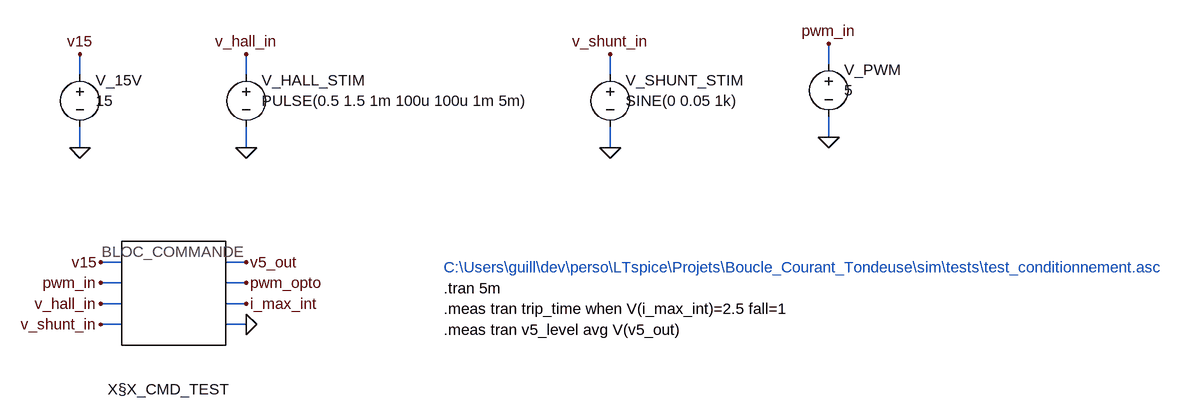
[diagram p0: schematic test_conditionnement.asc]
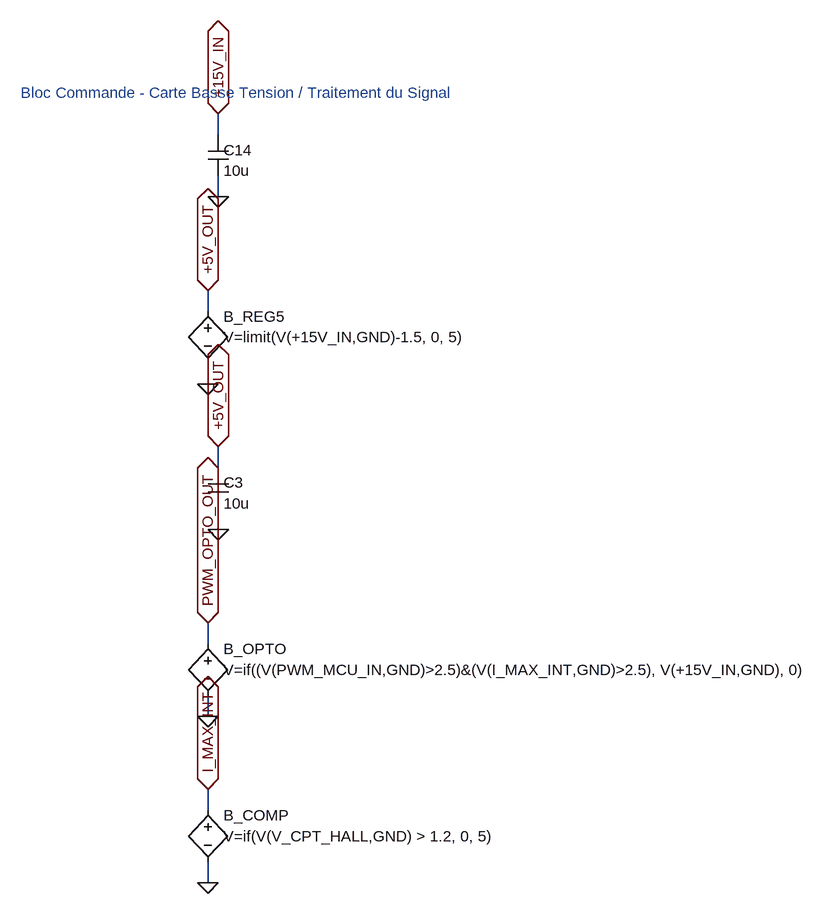
[diagram p1: sub-circuit bloc_commande.asc]
test_conditionnement.asc, the LTspice schematic file:
Version 4.1
SHEET 1 3200 2400
WIRE 944 144 944 112
WIRE -208 160 -208 128
WIRE 48 160 48 128
WIRE 608 160 608 128
WIRE 944 256 944 224
WIRE -208 272 -208 240
WIRE 48 272 48 240
WIRE 608 272 608 240
WIRE -144 448 -176 448
WIRE 48 448 16 448
WIRE -144 480 -176 480
WIRE 48 480 16 480
WIRE -144 512 -176 512
WIRE 48 512 16 512
WIRE -144 544 -176 544
WIRE 48 544 16 544
FLAG -208 128 v15
FLAG -208 272 0
FLAG 48 128 v_hall_in
FLAG 48 272 0
FLAG 608 128 v_shunt_in
FLAG 608 272 0
FLAG 944 112 pwm_in
FLAG 944 256 0
FLAG -176 448 v15
FLAG -176 480 pwm_in
FLAG -176 512 v_hall_in
FLAG -176 544 v_shunt_in
FLAG 48 448 v5_out
FLAG 48 480 pwm_opto
FLAG 48 512 i_max_int
FLAG 48 544 0
SYMBOL voltage -208 144 R0
WINDOW 0 24 24 Left 2
WINDOW 3 24 56 Left 2
SYMATTR InstName V_15V
SYMATTR Value 15
SYMBOL voltage 48 144 R0
WINDOW 0 24 24 Left 2
WINDOW 3 24 56 Left 2
SYMATTR InstName V_HALL_STIM
SYMATTR Value PULSE(0.5 1.5 1m 100u 100u 1m 5m)
SYMBOL voltage 608 144 R0
WINDOW 0 24 24 Left 2
WINDOW 3 24 56 Left 2
SYMATTR InstName V_SHUNT_STIM
SYMATTR Value SINE(0 0.05 1k)
SYMBOL voltage 944 128 R0
WINDOW 0 24 24 Left 2
WINDOW 3 24 56 Left 2
SYMATTR InstName V_PWM
SYMATTR Value 5
SYMBOL ..\\blocks\\bloc_commande -64 496 R0
WINDOW 0 -101 148 Left 2
WINDOW 3 24 56 Left 2
SYMATTR InstName X§X_CMD_TEST
TEXT 352 456 Left 2 ;C:\\Users\\guill\\dev\\perso\\LTspice\\Projets\\Boucle_Courant_Tondeuse\\sim\\tests\\test_conditionnement.asc
TEXT 352 488 Left 2 !.tran 5m
TEXT 352 520 Left 2 !.meas tran trip_time when V(i_max_int)=2.5 fall=1
TEXT 352 552 Left 2 !.meas tran v5_level avg V(v5_out)

bloc_commande.asc, the sub-circuit schematic file:
Version 4
SHEET 1 3200 2400
TEXT 32 32 Left 2 ;Bloc Commande - Carte Basse Tension / Traitement du Signal
SYMBOL cap 320 96 R0
WINDOW 0 24 24 Left 2
WINDOW 3 24 56 Left 2
SYMATTR InstName C14
SYMATTR Value 10u
WIRE 336 96 336 64
FLAG 336 64 +15V_IN
IOPIN 336 64 BiDir
WIRE 336 160 336 192
FLAG 336 192 0
IOPIN 336 192 BiDir
SYMBOL bv 320 352 R0
WINDOW 0 24 24 Left 2
WINDOW 3 24 56 Left 2
SYMATTR InstName B_REG5
SYMATTR Value V=limit(V(+15V_IN,GND)-1.5, 0, 5)
WIRE 320 368 320 336
FLAG 320 336 +5V_OUT
IOPIN 320 336 BiDir
WIRE 320 448 320 480
FLAG 320 480 0
IOPIN 320 480 BiDir
SYMBOL cap 320 608 R0
WINDOW 0 24 24 Left 2
WINDOW 3 24 56 Left 2
SYMATTR InstName C3
SYMATTR Value 10u
WIRE 336 608 336 576
FLAG 336 576 +5V_OUT
IOPIN 336 576 BiDir
WIRE 336 672 336 704
FLAG 336 704 0
IOPIN 336 704 BiDir
SYMBOL bv 320 864 R0
WINDOW 0 24 24 Left 2
WINDOW 3 24 56 Left 2
SYMATTR InstName B_OPTO
SYMATTR Value V=if((V(PWM_MCU_IN,GND)>2.5)&(V(I_MAX_INT,GND)>2.5), V(+15V_IN,GND), 0)
WIRE 320 880 320 848
FLAG 320 848 PWM_OPTO_OUT
IOPIN 320 848 BiDir
WIRE 320 960 320 992
FLAG 320 992 0
IOPIN 320 992 BiDir
SYMBOL bv 320 1120 R0
WINDOW 0 24 24 Left 2
WINDOW 3 24 56 Left 2
SYMATTR InstName B_COMP
SYMATTR Value V=if(V(V_CPT_HALL,GND) > 1.2, 0, 5)
WIRE 320 1136 320 1104
FLAG 320 1104 I_MAX_INT
IOPIN 320 1104 BiDir
WIRE 320 1216 320 1248
FLAG 320 1248 0
IOPIN 320 1248 BiDir

The netlist it stands for:
* test_conditionnement.asc
V_15V v15 0 15
V_HALL_STIM v_hall_in 0 PULSE(0.5 1.5 1m 100u 100u 1m 5m)
V_SHUNT_STIM v_shunt_in 0 SINE(0 0.05 1k)
V_PWM pwm_in 0 5
X§X§X_CMD_TEST v15 pwm_in v_hall_in v_shunt_in v5_out pwm_opto i_max_int 0 bloc_commande

* block symbol definitions
.subckt bloc_commande +15V_IN PWM_MCU_IN V_CPT_HALL SENS_I +5V_OUT PWM_OPTO_OUT I_MAX_INT GND
C14 +15V_IN 0 10u
B_REG5 +5V_OUT 0 V=limit(V(+15V_IN,GND)-1.5, 0, 5)
C3 +5V_OUT 0 10u
B_OPTO PWM_OPTO_OUT 0 V=if((V(PWM_MCU_IN,GND)>2.5)&(V(I_MAX_INT,GND)>2.5), V(+15V_IN,GND), 0)
B_COMP I_MAX_INT 0 V=if(V(V_CPT_HALL,GND) > 1.2, 0, 5)
* Bloc Commande - Carte Basse Tension / Traitement du Signal
.ends bloc_commande

* C:\Users\guill\dev\perso\LTspice\Projets\Boucle_Courant_Tondeuse\sim\tests\test_conditionnement.asc
.tran 5m
.meas tran trip_time when V(i_max_int)=2.5 fall=1
.meas tran v5_level avg V(v5_out)
.backanno
.end